# Altium schematic sheet Inputs.SchDoc
size A; SheetNumber: 4; SheetTotal: 5
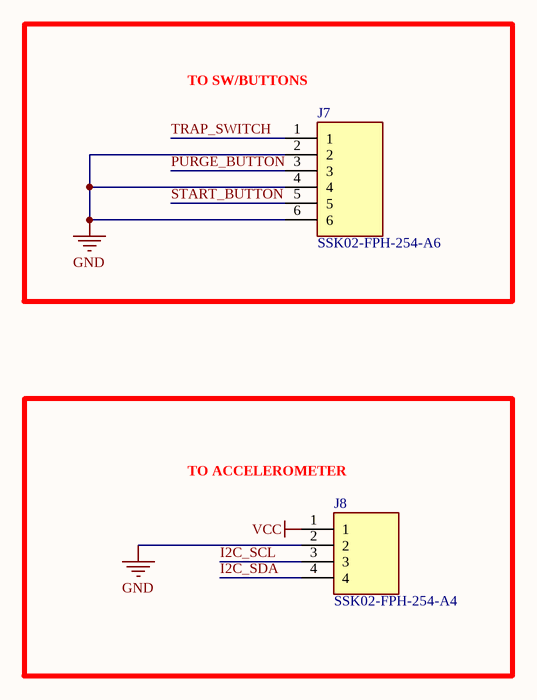
[diagram p0: Inputs.SchDoc]

## Parts
J7  SSK02-FPH-254-A6  [SAMESKY_SSK02-FPH-254-A6]
J8  SSK02-FPH-254-A4  [SAMESKY_SSK02-FPH-254-A4]

## Blocks framed on the sheet
TO SW/BUTTONS: J7
TO ACCELEROMETER: J8

## Nets
GND: J7.2 J7.4 J7.6 J8.2
VCC: J8.1
I2C_SCL: J8.3
I2C_SDA: J8.4
PURGE_BUTTON: J7.3
START_BUTTON: J7.5
TRAP_SWITCH: J7.1

## Library data of the parts
J7 = SSK02-FPH-254-A6: 6 Position Header Connector 0.100 (2.54mm) Through Hole Gold; MF: Same Sky (Formerly CUI Devices); SnapEDA_Link: https://www.snapeda.com/parts/SSK02-FPH-254-A6/Same+Sky/view-part/?ref=snap; Package: None; Value: *; MP: SSK02-FPH-254-A6; Check_prices: https://www.snapeda.com/parts/SSK02-FPH-254-A6/Same+Sky/view-part/?ref=eda
J8 = SSK02-FPH-254-A4: 4 Position Header Connector 0.100 (2.54mm) Through Hole Gold; MF: Same Sky (Formerly CUI Devices); SnapEDA_Link: https://www.snapeda.com/parts/SSK02-FPH-254-A4/Same+Sky/view-part/?ref=snap; Package: None; Value: *; MP: SSK02-FPH-254-A4; Check_prices: https://www.snapeda.com/parts/SSK02-FPH-254-A4/Same+Sky/view-part/?ref=eda